# Altium schematic sheet HI_Curr_ADP1850.SchDoc: HI_CURR_ADP1850 (part 1 of 2)
size A3
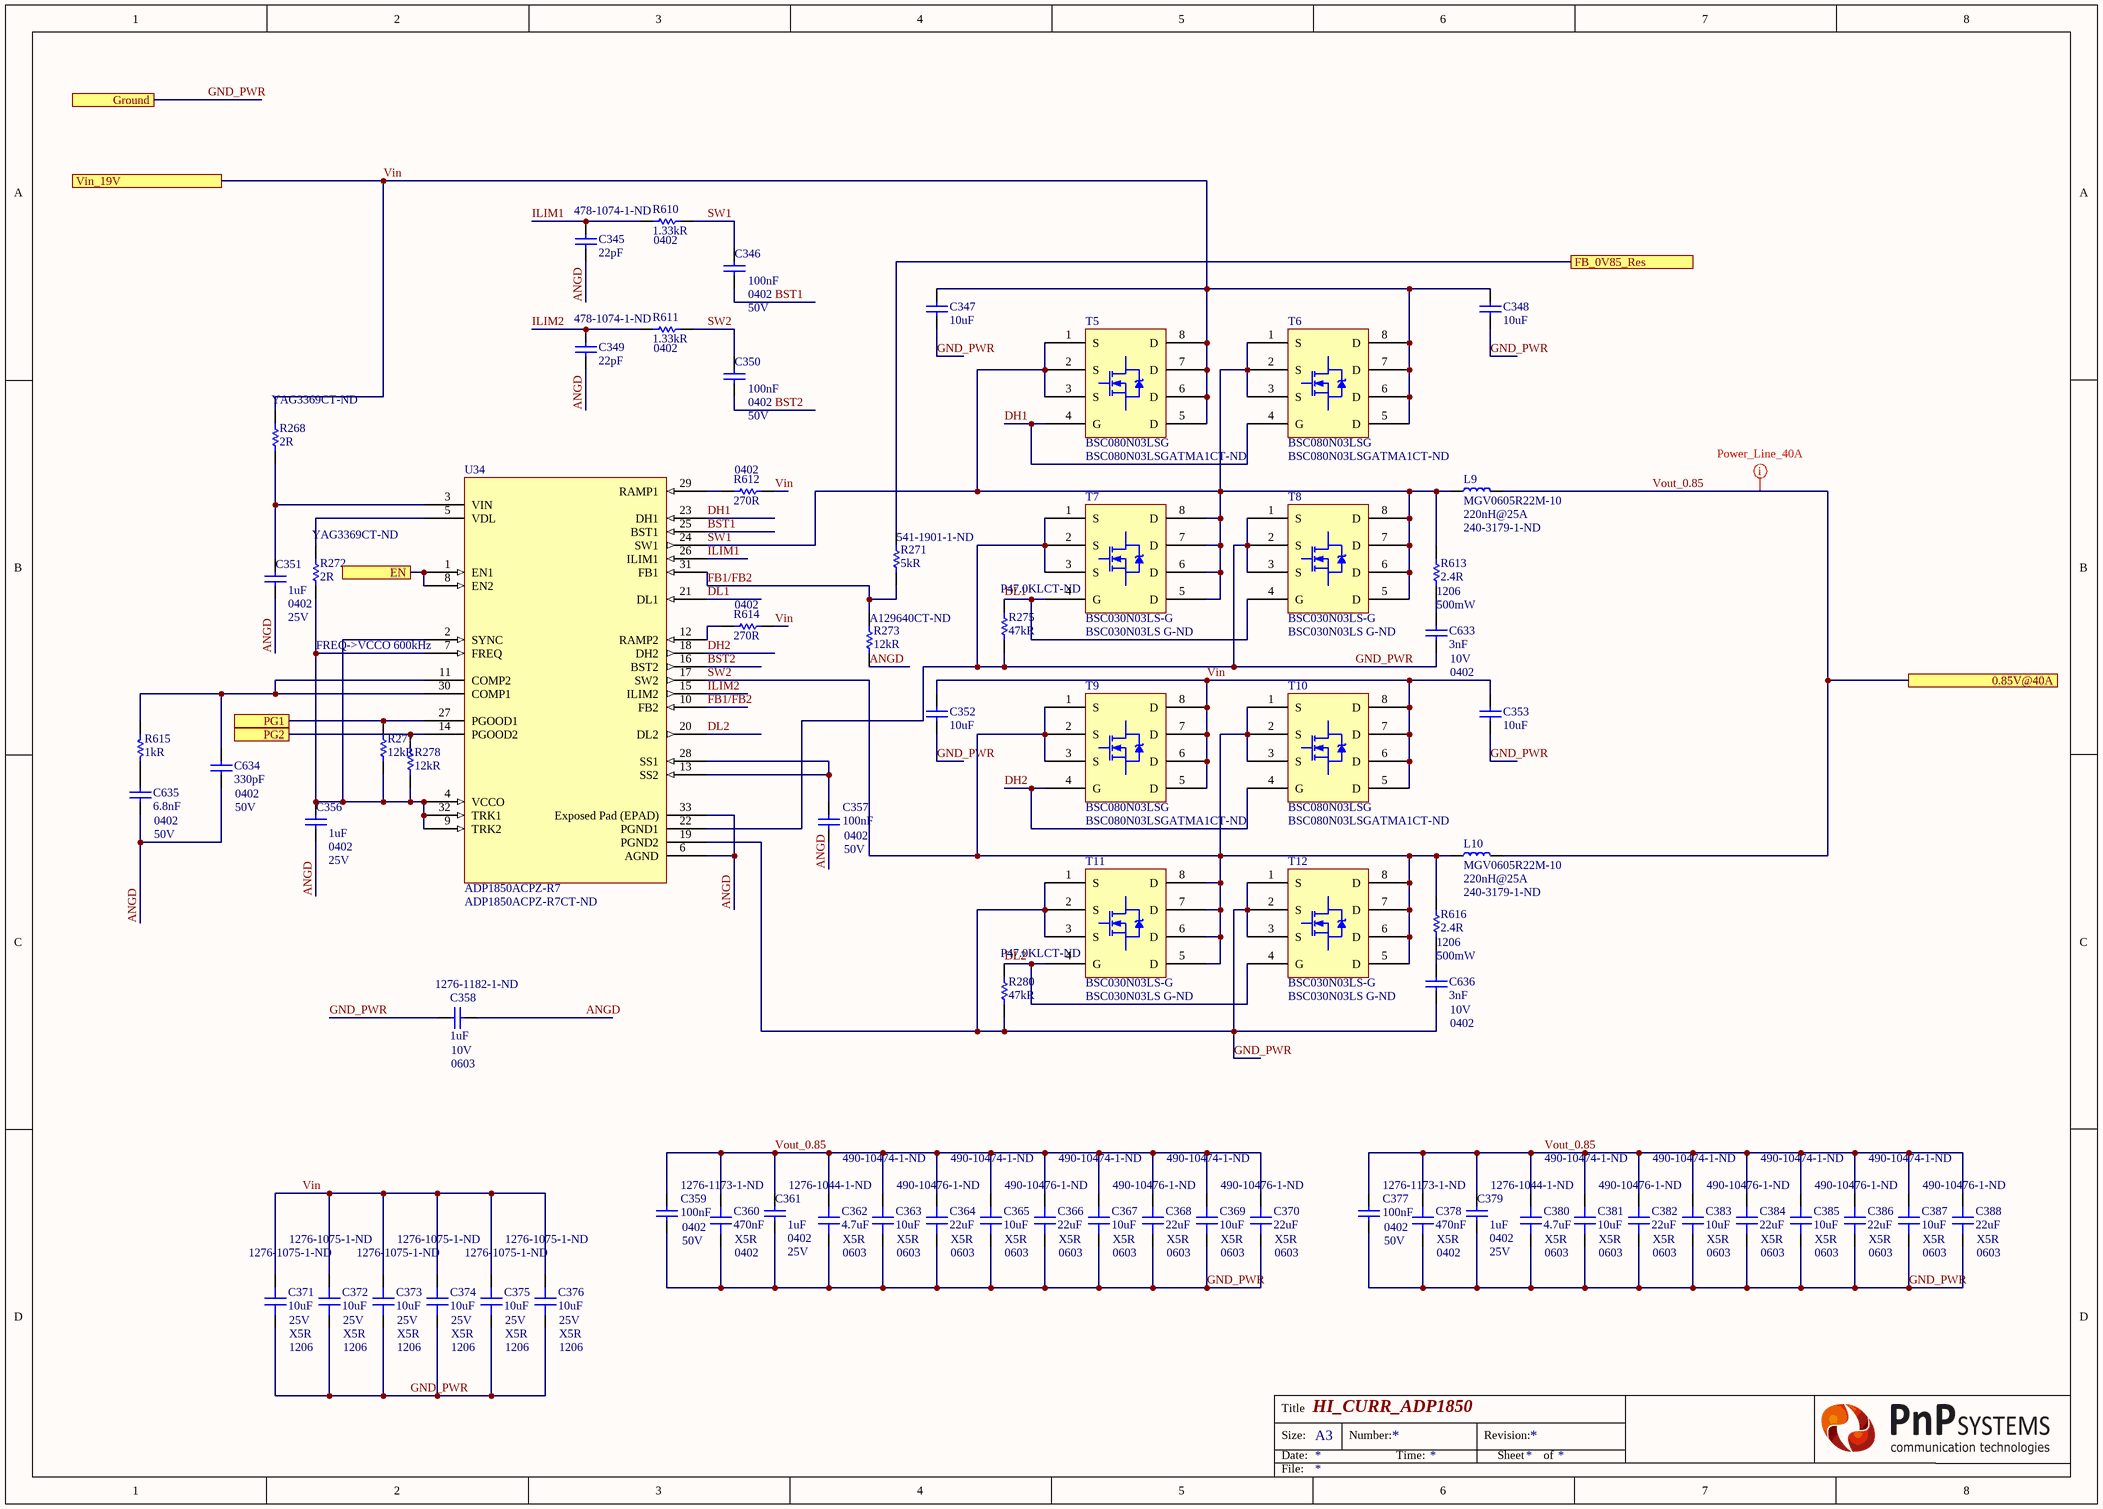
[diagram p0: HI_Curr_ADP1850.SchDoc]

## Parts
C345  22pF  Supplier Part Number 1: 478-1074-1-ND  [CAP 0402/1005 KK]
C346  100nF  Case Code (Imperial): 0402  Voltage: 50V  [CAP 0402/1005 KK]
C347  10uF  [CAP 1206/3216]
C348  10uF  [CAP 1206/3216]
C349  22pF  Supplier Part Number 1: 478-1074-1-ND  [CAP 0402/1005 KK]
C350  100nF  Case Code (Imperial): 0402  Voltage: 50V  [CAP 0402/1005 KK]
C351  1uF  Case/Package: 0402  Voltage Rating: 25V  [CAP 0402/1005 KK]
C352  10uF  [CAP 1206/3216]
C353  10uF  [CAP 1206/3216]
C356  1uF  Case/Package: 0402  Voltage Rating: 25V  [CAP 0402/1005 KK]
C357  100nF  Case Code (Imperial): 0402  Voltage: 50V  [CAP 0402/1005 KK]
C358  1uF  Supplier Part Number 1: 1276-1182-1-ND  Case/Package: 0603  Voltage Rating: 10V  [CAP 0603/1608 RF]
C359  100nF  Case Code (Imperial): 0402  Voltage: 50V  [CAP 0402/1005 KK]
C360  470nF  Supplier Part Number 1: 1276-1173-1-ND  Case/Package: 0402  Dielectric: X5R  [CAP 0402/1005 KK]
C361  1uF  Case/Package: 0402  Voltage Rating: 25V  [CAP 0402/1005 KK]
C362  4.7uF  Supplier Part Number 1: 1276-1044-1-ND  Case/Package: 0603  Dielectric: X5R  [CAP 0603/1608 RF]
C363  10uF  Supplier Part Number 1: 490-10474-1-ND  Case/Package: 0603  Dielectric: X5R  [CAP 0603/1608 RF]
C364  22uF  Supplier Part Number 1: 490-10476-1-ND  Case/Package: 0603  Dielectric: X5R  [CAP 0603/1608 RF]
C365  10uF  Supplier Part Number 1: 490-10474-1-ND  Case/Package: 0603  Dielectric: X5R  [CAP 0603/1608 RF]
C366  22uF  Supplier Part Number 1: 490-10476-1-ND  Case/Package: 0603  Dielectric: X5R  [CAP 0603/1608 RF]
C367  10uF  Supplier Part Number 1: 490-10474-1-ND  Case/Package: 0603  Dielectric: X5R  [CAP 0603/1608 RF]
C368  22uF  Supplier Part Number 1: 490-10476-1-ND  Case/Package: 0603  Dielectric: X5R  [CAP 0603/1608 RF]
C369  10uF  Supplier Part Number 1: 490-10474-1-ND  Case/Package: 0603  Dielectric: X5R  [CAP 0603/1608 RF]
C370  22uF  Supplier Part Number 1: 490-10476-1-ND  Case/Package: 0603  Dielectric: X5R  [CAP 0603/1608 RF]
C371  10uF  Supplier Part Number 1: 1276-1075-1-ND  Case/Package: 1206  Dielectric: X5R  Voltage: 25V  [CAP 1206/3216 - 0.8MM]
C372  10uF  Supplier Part Number 1: 1276-1075-1-ND  Case/Package: 1206  Dielectric: X5R  Voltage: 25V  [CAP 1206/3216 - 0.8MM]
C373  10uF  Supplier Part Number 1: 1276-1075-1-ND  Case/Package: 1206  Dielectric: X5R  Voltage: 25V  [CAP 1206/3216 - 0.8MM]
C374  10uF  Supplier Part Number 1: 1276-1075-1-ND  Case/Package: 1206  Dielectric: X5R  Voltage: 25V  [CAP 1206/3216 - 0.8MM]
C375  10uF  Supplier Part Number 1: 1276-1075-1-ND  Case/Package: 1206  Dielectric: X5R  Voltage: 25V  [CAP 1206/3216 - 0.8MM]
C376  10uF  Supplier Part Number 1: 1276-1075-1-ND  Case/Package: 1206  Dielectric: X5R  Voltage: 25V  [CAP 1206/3216 - 0.8MM]
C377  100nF  Case Code (Imperial): 0402  Voltage: 50V  [CAP 0402/1005 KK]
C378  470nF  Supplier Part Number 1: 1276-1173-1-ND  Case/Package: 0402  Dielectric: X5R  [CAP 0402/1005 KK]
C379  1uF  Case/Package: 0402  Voltage Rating: 25V  [CAP 0402/1005 KK]
C380  4.7uF  Supplier Part Number 1: 1276-1044-1-ND  Case/Package: 0603  Dielectric: X5R  [CAP 0603/1608 RF]
C381  10uF  Supplier Part Number 1: 490-10474-1-ND  Case/Package: 0603  Dielectric: X5R  [CAP 0603/1608 RF]
C382  22uF  Supplier Part Number 1: 490-10476-1-ND  Case/Package: 0603  Dielectric: X5R  [CAP 0603/1608 RF]
C383  10uF  Supplier Part Number 1: 490-10474-1-ND  Case/Package: 0603  Dielectric: X5R  [CAP 0603/1608 RF]
C384  22uF  Supplier Part Number 1: 490-10476-1-ND  Case/Package: 0603  Dielectric: X5R  [CAP 0603/1608 RF]
C385  10uF  Supplier Part Number 1: 490-10474-1-ND  Case/Package: 0603  Dielectric: X5R  [CAP 0603/1608 RF]
C386  22uF  Supplier Part Number 1: 490-10476-1-ND  Case/Package: 0603  Dielectric: X5R  [CAP 0603/1608 RF]
C387  10uF  Supplier Part Number 1: 490-10474-1-ND  Case/Package: 0603  Dielectric: X5R  [CAP 0603/1608 RF]
C388  22uF  Supplier Part Number 1: 490-10476-1-ND  Case/Package: 0603  Dielectric: X5R  [CAP 0603/1608 RF]
C633  3nF  Case Code (Imperial): 0402  Voltage Rating: 10V  [CAP 0402/1005 KK]
C634  330pF  Case Code (Imperial): 0402  Voltage Rating: 50V  [CAP 0402/1005 KK]
C635  6.8nF  Case Code (Imperial): 0402  Voltage: 50V  [CAP 0402/1005 KK]
C636  3nF  Case Code (Imperial): 0402  Voltage Rating: 10V  [CAP 0402/1005 KK]
L9  MGV0605R22M-10  Inductance: 220nH@25A  Supplier Part Number 1: 240-3179-1-ND  [MGV0605]
L10  MGV0605R22M-10  Inductance: 220nH@25A  Supplier Part Number 1: 240-3179-1-ND  [MGV0605]
R268  2R  Supplier Part Number 1: YAG3369CT-ND  [RES 0402/1005 RF KK]
R271  5kR  Supplier Part Number 1: 541-1901-1-ND  [RES 0402/1005 RF KK]
R272  2R  Supplier Part Number 1: YAG3369CT-ND  [RES 0402/1005 RF KK]
R273  12kR  Supplier Part Number 1: A129640CT-ND  [RES 0402/1005 RF KK]
R275  47kR  Supplier Part Number 1: P47.0KLCT-ND  [RES 0402/1005 RF KK]
R277  12kR  [RES 0402/1005 RF KK]
R278  12kR  [RES 0402/1005 RF KK]
R280  47kR  Supplier Part Number 1: P47.0KLCT-ND  [RES 0402/1005 RF KK]
R610  1.33kR  Case Code (Imperial): 0402  [RES 0402/1005 RF KK]
R611  1.33kR  Case Code (Imperial): 0402  [RES 0402/1005 RF KK]
R612  270R  Case/Package: 0402  [RES 0402/1005 RF KK]
R613  2.4R  Case Code (Imperial): 1206  Max Power Dissipation: 500mW  [RES 1206/3216]
R614  270R  Case/Package: 0402  [RES 0402/1005 RF KK]
R615  1kR  [RES 0402/1005 RF KK]
R616  2.4R  Case Code (Imperial): 1206  Max Power Dissipation: 500mW  [RES 1206/3216]
T5  BSC080N03LSG  Supplier Part Number 1: BSC080N03LSGATMA1CT-ND  [BSC080N03LS]
T6  BSC080N03LSG  Supplier Part Number 1: BSC080N03LSGATMA1CT-ND  [BSC080N03LS]
T7  BSC030N03LS-G  Supplier Part Number 1: BSC030N03LS G-ND  [BSC030N03LS]
T8  BSC030N03LS-G  Supplier Part Number 1: BSC030N03LS G-ND  [BSC030N03LS]
T9  BSC080N03LSG  Supplier Part Number 1: BSC080N03LSGATMA1CT-ND  [BSC080N03LS]
T10  BSC080N03LSG  Supplier Part Number 1: BSC080N03LSGATMA1CT-ND  [BSC080N03LS]
T11  BSC030N03LS-G  Supplier Part Number 1: BSC030N03LS G-ND  [BSC030N03LS]
T12  BSC030N03LS-G  Supplier Part Number 1: BSC030N03LS G-ND  [BSC030N03LS]
U34  ADP1850ACPZ-R7  Supplier Part Number 1: ADP1850ACPZ-R7CT-ND  [ADP1850]

## Ports
0.85V@40A, EN, FB_0V85_Res, Ground, PG1, PG2, Vin_19V

## Nets
ANGD: C345.1 C349.1 C351.2 C356.2 C357.1 C358.2 C634.1 C635.1 R273.1 U34.6(AGND) U34.33(Exposed_Pad_(EPAD))
BST1: C346.1 U34.25(BST1)
BST2: C350.1 U34.16(BST2)
DH1: T5.4(G) T6.4(G) U34.23(DH1)
DH2: T9.4(G) T10.4(G) U34.18(DH2)
DL1: R275.2 T7.4(G) T8.4(G) U34.21(DL1)
DL2: R280.2 T11.4(G) T12.4(G) U34.20(DL2)
EN: U34.1(EN1) U34.8(EN2) ; port EN
FB1/FB2: R271.1 R273.2 U34.10(FB2) U34.31(FB1)
FB_0V85_Res: R271.2 ; port FB_0V85_Res
GND_PWR: C347.1 C348.1 C352.1 C353.1 C358.1 C359.1 C360.1 C361.2 C362.1 C363.1 C364.1 C365.1 C366.1 C367.1 C368.1 C369.1 C370.1 C371.1 C372.1 C373.1 C374.1 C375.1 C376.1 C377.1 C378.1 C379.2 C380.1 C381.1 C382.1 C383.1 C384.1 C385.1 C386.1 C387.1 C388.1 C633.1 C636.1 R275.1 R280.1 T7.1(S) T7.2(S) T7.3(S) T8.1(S) T8.2(S) T8.3(S) T11.1(S) T11.2(S) T11.3(S) T12.1(S) T12.2(S) T12.3(S) U34.19(PGND2) U34.22(PGND1) ; port Ground
ILIM1: C345.2 R610.1 U34.26(ILIM1)
ILIM2: C349.2 R611.1 U34.15(ILIM2)
PG1: R277.2 U34.27(PGOOD1) ; port PG1
PG2: R278.2 U34.14(PGOOD2) ; port PG2
SW1: C346.2 L9.1 R610.2 R613.2 T5.1(S) T5.2(S) T5.3(S) T6.1(S) T6.2(S) T6.3(S) T7.5(D) T7.6(D) T7.7(D) T7.8(D) T8.5(D) T8.6(D) T8.7(D) T8.8(D) U34.24(SW1)
SW2: C350.2 L10.1 R611.2 R616.2 T9.1(S) T9.2(S) T9.3(S) T10.1(S) T10.2(S) T10.3(S) T11.5(D) T11.6(D) T11.7(D) T11.8(D) T12.5(D) T12.6(D) T12.7(D) T12.8(D) U34.17(SW2)
Vin: C347.2 C348.2 C352.2 C353.2 C371.2 C372.2 C373.2 C374.2 C375.2 C376.2 R268.1 R612.2 R614.2 T5.5(D) T5.6(D) T5.7(D) T5.8(D) T6.5(D) T6.6(D) T6.7(D) T6.8(D) T9.5(D) T9.6(D) T9.7(D) T9.8(D) T10.5(D) T10.6(D) T10.7(D) T10.8(D) ; port Vin_19V
Vout_0.85: C359.2 C360.2 C361.1 C362.2 C363.2 C364.2 C365.2 C366.2 C367.2 C368.2 C369.2 C370.2 C377.2 C378.2 C379.1 C380.2 C381.2 C382.2 C383.2 C384.2 C385.2 C386.2 C387.2 C388.2 L9.2 L10.2 ; port 0.85V@40A
NetC351_1: C351.1 R268.2 U34.3(VIN)
NetC356_1: C356.1 R272.2 R277.1 R278.1 U34.2(SYNC) U34.4(VCCO) U34.7(FREQ) U34.9(TRK2) U34.32(TRK1)
NetC357_2: C357.2 U34.13(SS2) U34.28(SS1)
NetC633_2: C633.2 R613.1
NetC634_2: C634.2 R615.2 U34.11(COMP2) U34.30(COMP1)
NetC635_2: C635.2 R615.1
NetC636_2: C636.2 R616.1
NetR272_1: R272.1 U34.5(VDL)
NetR612_1: R612.1 U34.29(RAMP1)
NetR614_1: R614.1 U34.12(RAMP2)

## Layout directives
net class Power_Line_40A: Vout_0.85

## Notes on the sheet
- FREQ->VCCO 600kHz
- Title
- Size:
- Date:
- A3
- Number:
- Time:
- Revision:
- Sheet
- of
- File: